# Altium schematic sheet HEADERS.SchDoc: HEADERS
size A3; Author: Silvio Navaretti; CompanyName: Arduino srl; DocumentNumber: ABX00063; Revision: V1.2; SheetNumber: 2; SheetTotal: 8; RevAuthor: Silvio Navaretti
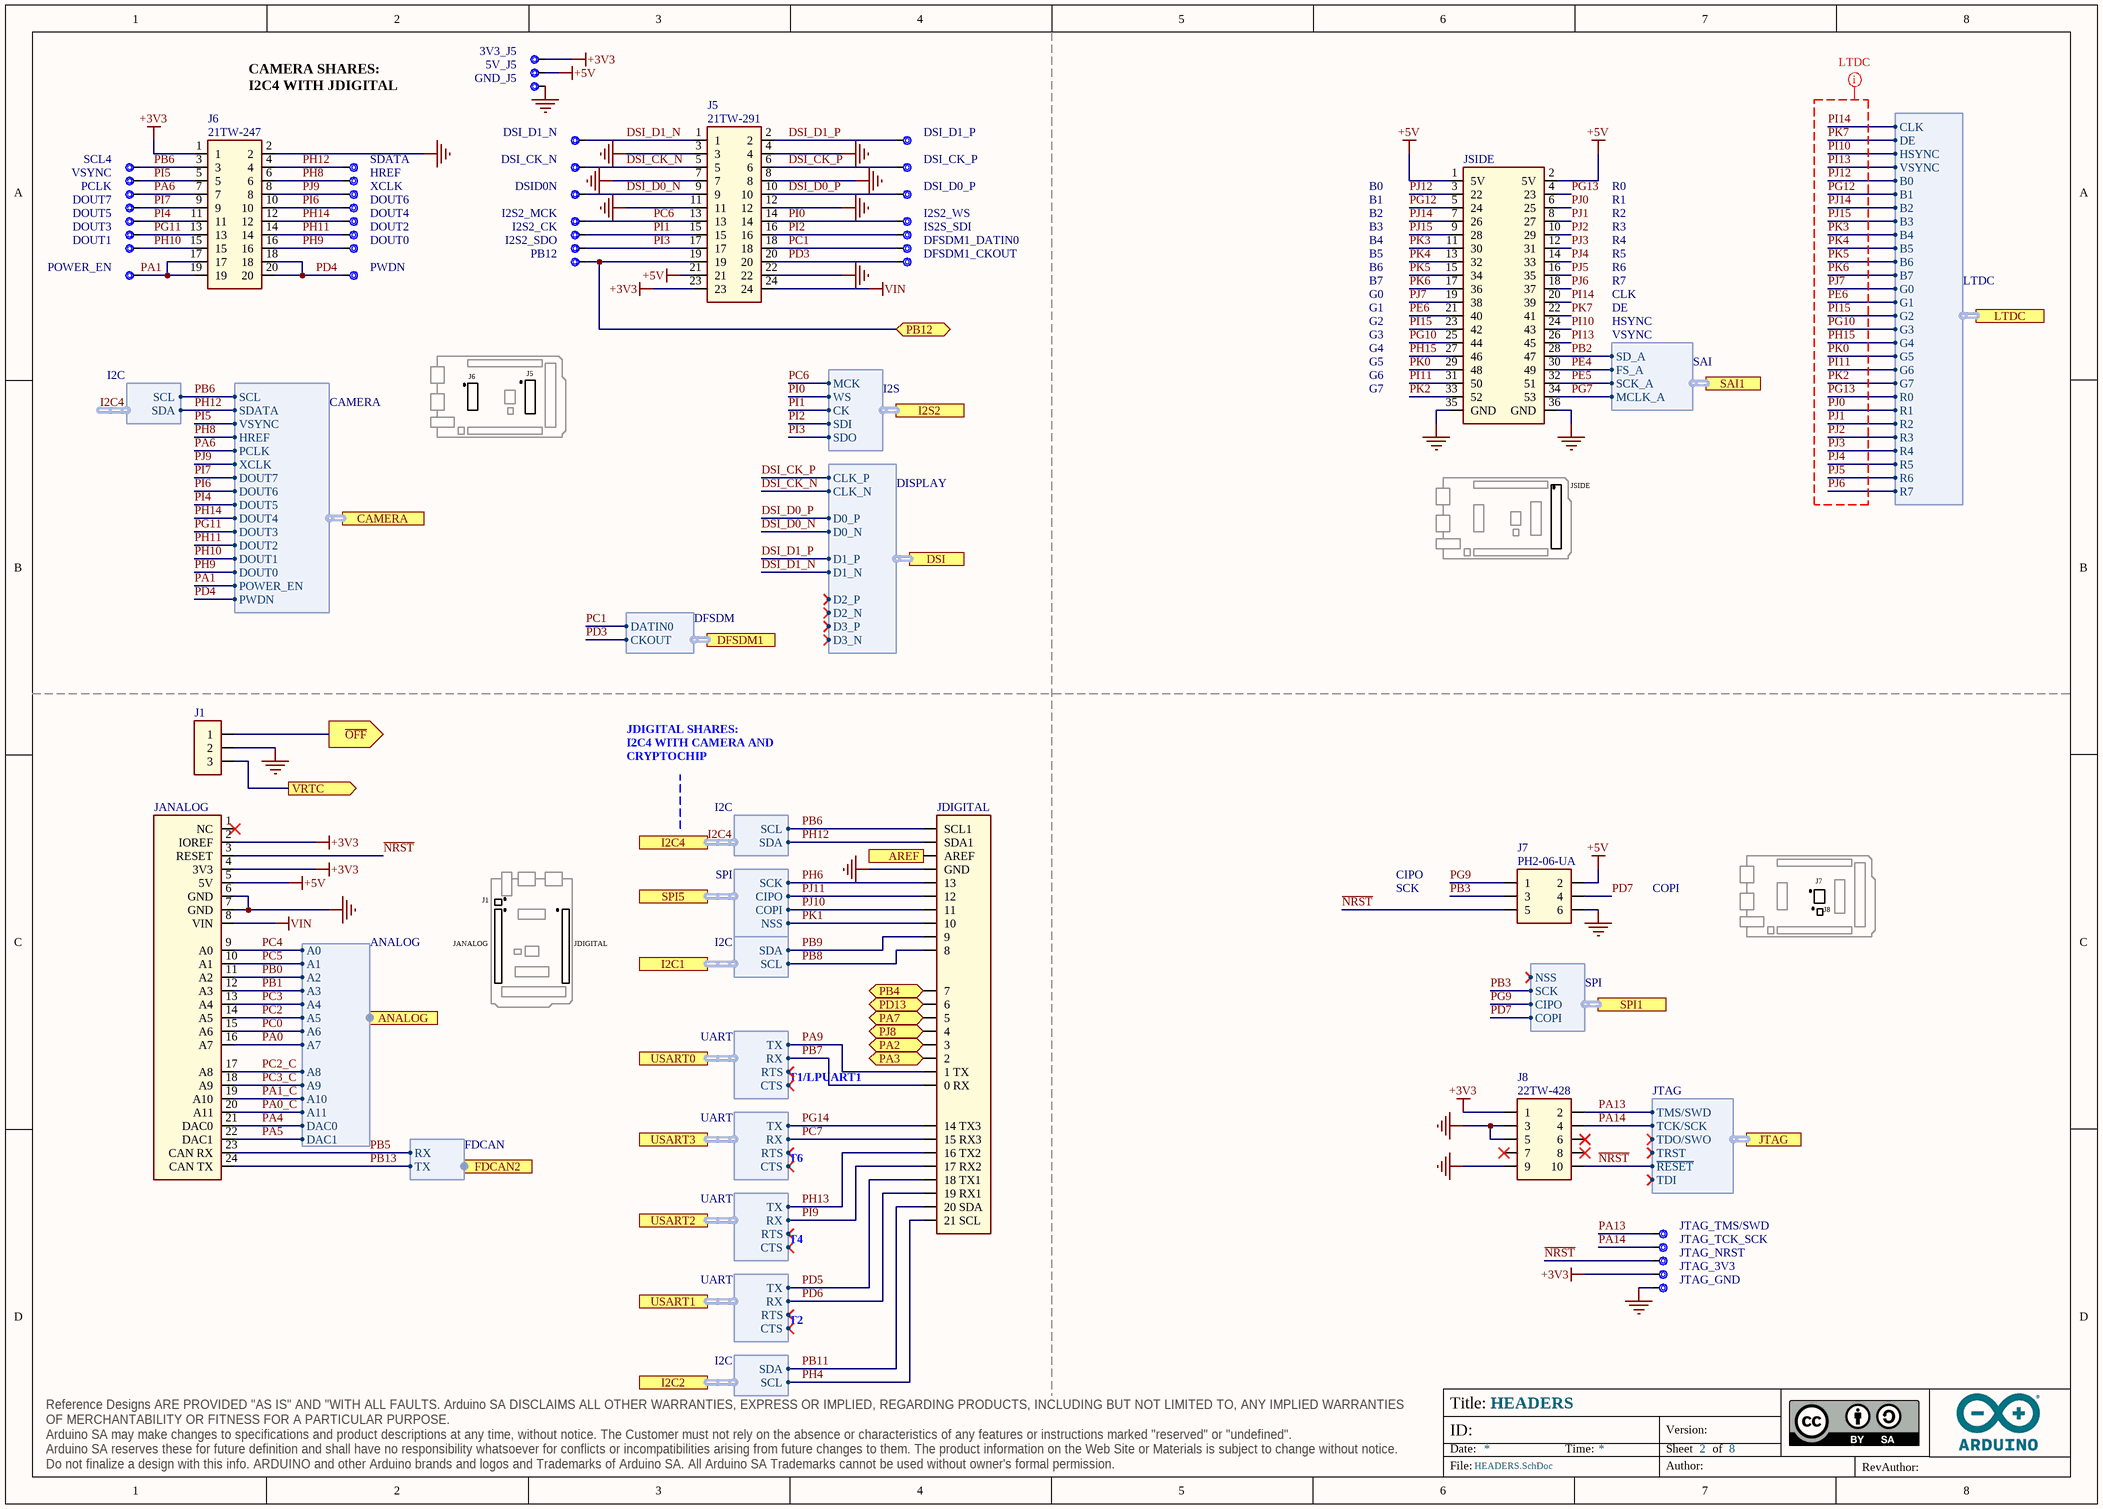
[diagram p0: HEADERS.SchDoc]

## Parts
3V3_J5  CMP-018-0005-A.3  [TP-1.00MM]  (value not drawn)  (no BOM)
5V_J5  CMP-018-0005-A.3  [TP-1.00MM]  (value not drawn)  (no BOM)
DFSDM1_CKOUT  CMP-018-0005-A.3  [TP-1.00MM]  (value not drawn)  (no BOM)
DFSDM1_DATIN0  CMP-018-0005-A.3  [TP-1.00MM]  (value not drawn)  (no BOM)
DOUT0  CMP-018-0005-A.3  [TP-1.00MM]  (value not drawn)  (no BOM)
DOUT1  CMP-018-0005-A.3  [TP-1.00MM]  (value not drawn)  (no BOM)
DOUT2  CMP-018-0005-A.3  [TP-1.00MM]  (value not drawn)  (no BOM)
DOUT3  CMP-018-0005-A.3  [TP-1.00MM]  (value not drawn)  (no BOM)
DOUT4  CMP-018-0005-A.3  [TP-1.00MM]  (value not drawn)  (no BOM)
DOUT5  CMP-018-0005-A.3  [TP-1.00MM]  (value not drawn)  (no BOM)
DOUT6  CMP-018-0005-A.3  [TP-1.00MM]  (value not drawn)  (no BOM)
DOUT7  CMP-018-0005-A.3  [TP-1.00MM]  (value not drawn)  (no BOM)
DSI_CK_N  CMP-018-0005-A.3  [TP-1.00MM]  (value not drawn)  (no BOM)
DSI_CK_P  CMP-018-0005-A.3  [TP-1.00MM]  (value not drawn)  (no BOM)
DSI_D0_P  CMP-018-0005-A.3  [TP-1.00MM]  (value not drawn)  (no BOM)
DSI_D1_N  CMP-018-0005-A.3  [TP-1.00MM]  (value not drawn)  (no BOM)
DSI_D1_P  CMP-018-0005-A.3  [TP-1.00MM]  (value not drawn)  (no BOM)
DSID0N  CMP-018-0005-A.3  [TP-1.00MM]  (value not drawn)  (no BOM)
GND_J5  CMP-018-0005-A.3  [TP-1.00MM]  (value not drawn)  (no BOM)
HREF  CMP-018-0005-A.3  [TP-1.00MM]  (value not drawn)  (no BOM)
I2S2_CK  CMP-018-0005-A.3  [TP-1.00MM]  (value not drawn)  (no BOM)
I2S2_MCK  CMP-018-0005-A.3  [TP-1.00MM]  (value not drawn)  (no BOM)
I2S2_SDO  CMP-018-0005-A.3  [TP-1.00MM]  (value not drawn)  (no BOM)
I2S2_WS  CMP-018-0005-A.3  [TP-1.00MM]  (value not drawn)  (no BOM)
IS2S_SDI  CMP-018-0005-A.3  [TP-1.00MM]  (value not drawn)  (no BOM)
J1  HEADER TH 2.54mm VERT. 1x003POS  [PIN HEADER 2.54mm VERT. 1x3POS]  (value not drawn)  (no BOM)
J5  21TW-291  [21TW-291]
J6  21TW-247  [21TW-247]
J7  PH2-06-UA  [2X03]
J8  22TW-428  [FTSH-105-01-F-DV-Footprint-1]
JANALOG  20TW-887  [GIGA header custom analog]  (value not drawn)
JDIGITAL  20TW-890  [GIGA Header custom digital]  (value not drawn)
JSIDE  20TW-891  [GIGA custom header side-Footprint-1]  (value not drawn)
JTAG_3V3  CMP-018-0005-A.3  [TP-1.00MM]  (value not drawn)  (no BOM)
JTAG_GND  CMP-018-0005-A.3  [TP-1.00MM]  (value not drawn)  (no BOM)
JTAG_NRST  CMP-018-0005-A.3  [TP-1.00MM]  (value not drawn)  (no BOM)
JTAG_TCK_SCK  CMP-018-0005-A.3  [TP-1.00MM]  (value not drawn)  (no BOM)
JTAG_TMS/SWD  CMP-018-0005-A.3  [TP-1.00MM]  (value not drawn)  (no BOM)
PB12  CMP-018-0005-A.3  [TP-1.00MM]  (value not drawn)  (no BOM)
PCLK  CMP-018-0005-A.3  [TP-1.00MM]  (value not drawn)  (no BOM)
POWER_EN  CMP-018-0005-A.3  [TP-1.00MM]  (value not drawn)  (no BOM)
PWDN  CMP-018-0005-A.3  [TP-1.00MM]  (value not drawn)  (no BOM)
SCL4  CMP-018-0005-A.3  [TP-1.00MM]  (value not drawn)  (no BOM)
SDATA  CMP-018-0005-A.3  [TP-1.00MM]  (value not drawn)  (no BOM)
VSYNC  CMP-018-0005-A.3  [TP-1.00MM]  (value not drawn)  (no BOM)
XCLK  CMP-018-0005-A.3  [TP-1.00MM]  (value not drawn)  (no BOM)

## Ports
ANALOG (harness ANALOG), AREF (out), CAMERA (harness CAMERA), DFSDM1 (harness DFSDM), DSI (harness DISPLAY), FDCAN2 (harness FDCAN), I2C1 (harness I2C), I2C2 (harness I2C), I2C4 (harness I2C), I2S2 (harness I2S), JTAG (harness JTAG), LTDC (harness LTDC), PA2 (bidir), PA3 (bidir), PA7 (bidir), PB4 (bidir), PB12 (bidir), PD13 (bidir), PJ8 (bidir), SAI1 (harness SAI), SPI1 (harness SPI), SPI5 (harness SPI), USART0 (harness UART), USART1 (harness UART), USART2 (harness UART), USART3 (harness UART), VRTC (out), ~{OFF} (out)

## Harnesses
SPI: NSS, SCK, CIPO, COPI
I2C: SDA, SCL
LTDC: B0, B1, B2, B3, B4, B5, B6, B7, CLK, DE, G0, G1, G2, G3, G4, G5, G6, G7, HSYNC, R0, R1, R2, R3, R4, R5, R6, R7, VSYNC
SAI: SD_A, FS_A, SCK_A, MCLK_A
ANALOG: A0, A1, A2, A3, A7, A6, A5, A4, A8, A9, A10, A11, DAC0, DAC1
I2S: CK, SDI, SDO, WS, MCK
DISPLAY: CLK_N, CLK_P, D0_N, D0_P, D1_N, D1_P, D2_N, D2_P, D3_N, D3_P
DFSDM: DATIN0, CKOUT
CAMERA: SCL, SDATA, VSYNC, HREF, PCLK, XCLK, DOUT7, DOUT6, DOUT5, DOUT4, DOUT3, DOUT2, DOUT1, DOUT0, POWER_EN, PWDN
JTAG: ~{RESET}, TCK/SCK, TDI, TDO/SWO, TMS/SWD, TRST
UART: RX, TX, RTS, CTS
FDCAN: RX, TX

## Nets
+3V3: 3V3_J5.X J5.23 J6.1 J8.1 JANALOG.2(IOREF) JANALOG.4(3V3) JTAG_3V3.X
+5V: 5V_J5.X J5.21 J7.2 JANALOG.5(5V) JSIDE.1(5V) JSIDE.2(5V)
GND: GND_J5.X J1.2 J5.3 J5.4 J5.7 J5.8 J5.11 J5.12 J5.22 J6.2 J7.6 J8.3 J8.5 J8.9 JANALOG.6(GND) JANALOG.7(GND) JDIGITAL.4(GND) JSIDE.35(GND) JSIDE.36(GND) JTAG_GND.X
VIN: J5.24 JANALOG.8(VIN)
AREF: JDIGITAL.3(AREF) ; port AREF
DSI_CK_N: DSI_CK_N.X J5.5 ; port DSI.CLK_N
DSI_CK_P: DSI_CK_P.X J5.6 ; port DSI.CLK_P
DSI_D0_N: DSID0N.X J5.9 ; port DSI.D0_N
DSI_D0_P: DSI_D0_P.X J5.10 ; port DSI.D0_P
DSI_D1_N: DSI_D1_N.X J5.1 ; port DSI.D1_N
DSI_D1_P: DSI_D1_P.X J5.2 ; port DSI.D1_P
~{NRST}: J7.5 J8.10 JANALOG.3(RESET) JTAG_NRST.X ; port JTAG.~{RESET}
~{OFF}: J1.1 ; port ~{OFF}
PA0: JANALOG.16(A7) ; port ANALOG.A7
PA0_C: JANALOG.20(A11) ; port ANALOG.A11
PA1: J6.17 J6.19 POWER_EN.X ; port CAMERA.POWER_EN
PA1_C: JANALOG.19(A10) ; port ANALOG.A10
PA2: JDIGITAL.15(3) ; port PA2
PA3: JDIGITAL.16(2) ; port PA3
PA4: JANALOG.21(DAC0) ; port ANALOG.DAC0
PA5: JANALOG.22(DAC1) ; port ANALOG.DAC1
PA6: J6.7 PCLK.X ; port CAMERA.PCLK
PA7: JDIGITAL.13(5) ; port PA7
PA9: JDIGITAL.17(1_TX) ; port USART0.TX
PA13: J8.2 JTAG_TMS/SWD.X ; port JTAG.TMS/SWD
PA14: J8.4 JTAG_TCK_SCK.X ; port JTAG.TCK/SCK
PB0: JANALOG.11(A2) ; port ANALOG.A2
PB1: JANALOG.12(A3) ; port ANALOG.A3
PB2: JSIDE.28(47) ; port SAI1.SD_A
PB3: J7.3 ; port SPI1.SCK
PB4: JDIGITAL.11(7) ; port PB4
PB5: JANALOG.23(CAN_RX) ; port FDCAN2.RX
PB6: J6.3 JDIGITAL.1(SCL1) SCL4.X ; port CAMERA.SCL, port I2C4.SCL  [project net I2C4.SCL]
PB7: JDIGITAL.18(0_RX) ; port USART0.RX
PB8: JDIGITAL.10(8) ; port I2C1.SCL
PB9: JDIGITAL.9 ; port I2C1.SDA
PB11: JDIGITAL.25(20_SDA) ; port I2C2.SDA
PB12: J5.19 PB12.X ; port PB12
PB13: JANALOG.24(CAN_TX) ; port FDCAN2.TX
PC0: JANALOG.15(A6) ; port ANALOG.A6
PC1: DFSDM1_DATIN0.X J5.18 ; port DFSDM1.DATIN0
PC2: JANALOG.14(A5) ; port ANALOG.A5
PC2_C: JANALOG.17(A8) ; port ANALOG.A8
PC3: JANALOG.13(A4) ; port ANALOG.A4
PC3_C: JANALOG.18(A9) ; port ANALOG.A9
PC4: JANALOG.9(A0) ; port ANALOG.A0
PC5: JANALOG.10(A1) ; port ANALOG.A1
PC6: I2S2_MCK.X J5.13 ; port I2S2.MCK
PC7: JDIGITAL.20(15_RX3) ; port USART3.RX
PD3: DFSDM1_CKOUT.X J5.20 ; port DFSDM1.CKOUT
PD4: J6.18 J6.20 PWDN.X ; port CAMERA.PWDN
PD5: JDIGITAL.23(18_TX1) ; port USART1.TX
PD6: JDIGITAL.24(19_RX1) ; port USART1.RX
PD7: J7.4 ; port SPI1.COPI
PD13: JDIGITAL.12(6) ; port PD13
PE4: JSIDE.30(49) ; port SAI1.FS_A
PE5: JSIDE.32(51) ; port SAI1.SCK_A
PE6: JSIDE.21(40) ; port LTDC.G1
PG7: JSIDE.34(53) ; port SAI1.MCLK_A
PG9: J7.1 ; port SPI1.CIPO
PG10: JSIDE.25(44) ; port LTDC.G3
PG11: DOUT3.X J6.13 ; port CAMERA.DOUT3
PG12: JSIDE.5(24) ; port LTDC.B1
PG13: JSIDE.4(23) ; port LTDC.R0
PG14: JDIGITAL.19(14_TX3) ; port USART3.TX
PH4: JDIGITAL.26(21_SCL) ; port I2C2.SCL
PH6: JDIGITAL.5(13) ; port SPI5.SCK
PH8: HREF.X J6.6 ; port CAMERA.HREF
PH9: DOUT0.X J6.16 ; port CAMERA.DOUT0
PH10: DOUT1.X J6.15 ; port CAMERA.DOUT1
PH11: DOUT2.X J6.14 ; port CAMERA.DOUT2
PH12: J6.4 JDIGITAL.2(SDA1) SDATA.X ; port CAMERA.SDATA, port I2C4.SDA  [project net I2C4.SDA]
PH13: JDIGITAL.21(16_TX2) ; port USART2.TX
PH14: DOUT4.X J6.12 ; port CAMERA.DOUT4
PH15: JSIDE.27(46) ; port LTDC.G4
PI0: I2S2_WS.X J5.14 ; port I2S2.WS
PI1: I2S2_CK.X J5.15 ; port I2S2.CK
PI2: IS2S_SDI.X J5.16 ; port I2S2.SDI
PI3: I2S2_SDO.X J5.17 ; port I2S2.SDO
PI4: DOUT5.X J6.11 ; port CAMERA.DOUT5
PI5: J6.5 VSYNC.X ; port CAMERA.VSYNC
PI6: DOUT6.X J6.10 ; port CAMERA.DOUT6
PI7: DOUT7.X J6.9 ; port CAMERA.DOUT7
PI9: JDIGITAL.22(17_RX2) ; port USART2.RX
PI10: JSIDE.24(43) ; port LTDC.HSYNC
PI11: JSIDE.31(50) ; port LTDC.G6
PI13: JSIDE.26(45) ; port LTDC.VSYNC
PI14: JSIDE.20(39) ; port LTDC.CLK
PI15: JSIDE.23(42) ; port LTDC.G2
PJ0: JSIDE.6(25) ; port LTDC.R1
PJ1: JSIDE.8(27) ; port LTDC.R2
PJ2: JSIDE.10(29) ; port LTDC.R3
PJ3: JSIDE.12(31) ; port LTDC.R4
PJ4: JSIDE.14(33) ; port LTDC.R5
PJ5: JSIDE.16(35) ; port LTDC.R6
PJ6: JSIDE.18(37) ; port LTDC.R7
PJ7: JSIDE.19(38) ; port LTDC.G0
PJ8: JDIGITAL.14(4) ; port PJ8
PJ9: J6.8 XCLK.X ; port CAMERA.XCLK
PJ10: JDIGITAL.7(11) ; port SPI5.COPI
PJ11: JDIGITAL.6(12) ; port SPI5.CIPO
PJ12: JSIDE.3(22) ; port LTDC.B0
PJ14: JSIDE.7(26) ; port LTDC.B2
PJ15: JSIDE.9(28) ; port LTDC.B3
PK0: JSIDE.29(48) ; port LTDC.G5
PK1: JDIGITAL.8(10) ; port SPI5.NSS
PK2: JSIDE.33(52) ; port LTDC.G7
PK3: JSIDE.11(30) ; port LTDC.B4
PK4: JSIDE.13(32) ; port LTDC.B5
PK5: JSIDE.15(34) ; port LTDC.B6
PK6: JSIDE.17(36) ; port LTDC.B7
PK7: JSIDE.22(41) ; port LTDC.DE
VRTC: J1.3 ; port VRTC

Not connected (* = marked no-connect by the designer): J8 6* 7* 8*; JANALOG 1(NC)*

## Buses and harness runs
harness I2C4 = port I2C4

## Layout directives
net class LTDC: PE6, PG10, PG12, PG13, PH15, PI10, PI11, PI13, PI14, PI15, PJ0, PJ1, PJ2, PJ3, PJ4, PJ5, PJ6, PJ7, PJ12, PJ14, PJ15, PK0, PK2, PK3, PK4, PK5, PK6, PK7

## Notes on the sheet
- CAMERA SHARES:
  I2C4 WITH JDIGITAL
- B0
- B1
- B2
- B3
- B4
- R0
- R1
- R2
- R3
- R4
- B5
- B6
- B7
- G0
- G1
- R5
- R6
- R7
- CLK
- DE
- J6
- J5
- G2
- G3
- G4
- G5
- G6
- HSYNC
- VSYNC
- G7
- JSIDE
- JDIGITAL SHARES:
  I2C4 WITH CAMERA AND CRYPTOCHIP
- J1
- CIPO
- SCK
- COPI
- J7
- J8
- JANALOG
- JDIGITAL
- H7: USART1/LPUART1
- H7: USART6
- H7: USART4
- H7: USART2
- Title:
- ID:
- Date:
- Time:
- Version:
- Sheet
- of
- RevAuthor:
- Reference Designs ARE PROVIDED "AS IS" AND "WITH ALL FAULTS. Arduino SA DISCLAIMS ALL OTHER WARRANTIES, EXPRESS OR IMPLIED, REGARDING PRODUCTS, INCLUDING BUT NOT LIMITED TO, ANY IMPLIED WARRANTIES OF MERCHANTABILITY OR FITNESS FOR A PARTICULAR PURPOSE.
  Arduino SA may make changes to specifications and product descriptions at any time, without notice. The Customer must not rely on the absence or characteristics of any features or instructions marked "reserved" or "undefined".
  Arduino SA reserves these for future definition and shall have no responsibility whatsoever for conflicts or incompatibilities arising from future changes to them. The product information on the Web Site or Materials is subject to change without notice.
  Do not finalize a design with this info. ARDUINO and other Arduino brands and logos and Trademarks of Arduino SA. All Arduino SA Trademarks cannot be used without owner's formal permission.
- File:
- Author:

## Library data of the parts
3V3_J5 5V_J5 DFSDM1_CKOUT DFSDM1_DATIN0 DOUT0-DOUT7 DSI_CK_N DSI_CK_P DSI_D0_P DSI_D1_N DSI_D1_P DSID0N GND_J5 HREF I2S2_CK I2S2_MCK I2S2_SDO I2S2_WS IS2S_SDI JTAG_3V3 JTAG_GND JTAG_NRST JTAG_TCK_SCK JTAG_TMS/SWD PB12 PCLK POWER_EN PWDN SCL4 SDATA VSYNC XCLK = UT0013-A.4: Test point 1.00mm; Design Item ID: CMP-018-0005-A.3; Source: ut.SchLib; Pin Count: 1
J1 = J0237-A.2: MOUNT A MALE HEADER TH 2.54mm VERT. 1x003POS; Code Arduino: J0237
J5 = J0265-A.9: CONN SOCKET 2ROW 24POS VERTICAL PASS THROUGH + SMD with fixing + reel + cap for pick and place; Manufacturer: 4UCON; Connector Type: BOARD CONNECTOR; Code Arduino: J0265; Number of Contacts: 24; REACH SVHC: Yes; Termination: SMD/SMT; Part Number: 21TW-291; Mount: Board; Contact Material: Copper
J6 = J0249-A.9: CONN SOCKET 2ROW 20POS VERTICAL PASS THROUGH + SMD with fixing + pick and place cap, in reel; Manufacturer: 4UCON; Connector Type: BOARD CONNECTOR; Code Arduino: J0249; Number of Contacts: 20; REACH SVHC: Yes; Termination: SMD/SMT; Part Number: 21TW-247; Mount: Board; Contact Material: Copper
J7 = J0004-A.5: CONN Header Through Hole 6 position 0.100" (2.54mm); Manufacturer: Adam Tech; Code Arduino: 0114; Part Number: PH2-06-UA
J8 = J0089-A.11: CONN HEADER SMD 10POS 2x5 1.27MM JTAG reel, capsfor pick and place; Manufacturer: 4UCON; Code Arduino: J0089; Gender: Male; Current Rating: 1.75A; Connector Type: Male Pin; Contact Plating: Gold; Housing Material: Polymer; Contact Mating Length: 0.12inch; Packaging: Reel; Contact Material: Bronze; Pitch: 1.27mm; Mount: Surface Mount; Lead Free: Lead Free; Termination: Solder; Color: Black; Housing Color: Black; Part Number: 22TW-428; Length: 6.35mm; Depth: 3.43mm; Package Quantity: 1
JANALOG = J0313-A.5: CONN THD 24X1 CUSTOM PITCH DUE JANALOG GREY; Manufacturer: 4UCON; Number of Contacts: 24; Code Arduino: 3654; Number of Rows: 1; Part Number: 20TW-887; Number of Positions: 24; Pin Count: 24
JDIGITAL = J0262-A.10: CONN THD 1X26 CUSTOM PITCH DUE JDIGITAL GREY; Manufacturer: 4UCON; Code Arduino: 3653; Number of Positions: 26; Part Number: 20TW-890; Number of Rows: 1; Pin Count: 26; Number of Contacts: 26
JSIDE = J0315-A.4: CONN THD 18X2 36V DUE JSIDE CUSTOM GREY; Manufacturer: 4UCON; Number of Contacts: 36; Code Arduino: 3656; Number of Rows: 2; Part Number: 20TW-891; Number of Positions: 36